# Altium schematic sheet rev-b1_pod_4_Sensors.SchDoc
size 297 x 209 mm; Symbol: Drawing-Symbol_A4; @Project Name: Atrium_RevB1; @Page Count: 4; @Update Date: 2026-11-05; @Create Date: 2026-11-05; @Schematic Name: Pod_Schematic; @Page No: 4; @Page Name: P2; Company: Local Forge; Version: V1.0; Page Size: A4; Drawn: Het Bhavsar; Device: Drawing-Symbol_A4; @Create Time: 20:16:03; @Update Time: 20:16:03; Border: 1; Width: 1170; Height: 825; Region Start: 1; X Region Count: 6; Y Region Count: 4; Blade Width: 10; Title Block Position: 3; @Board Name: Pod
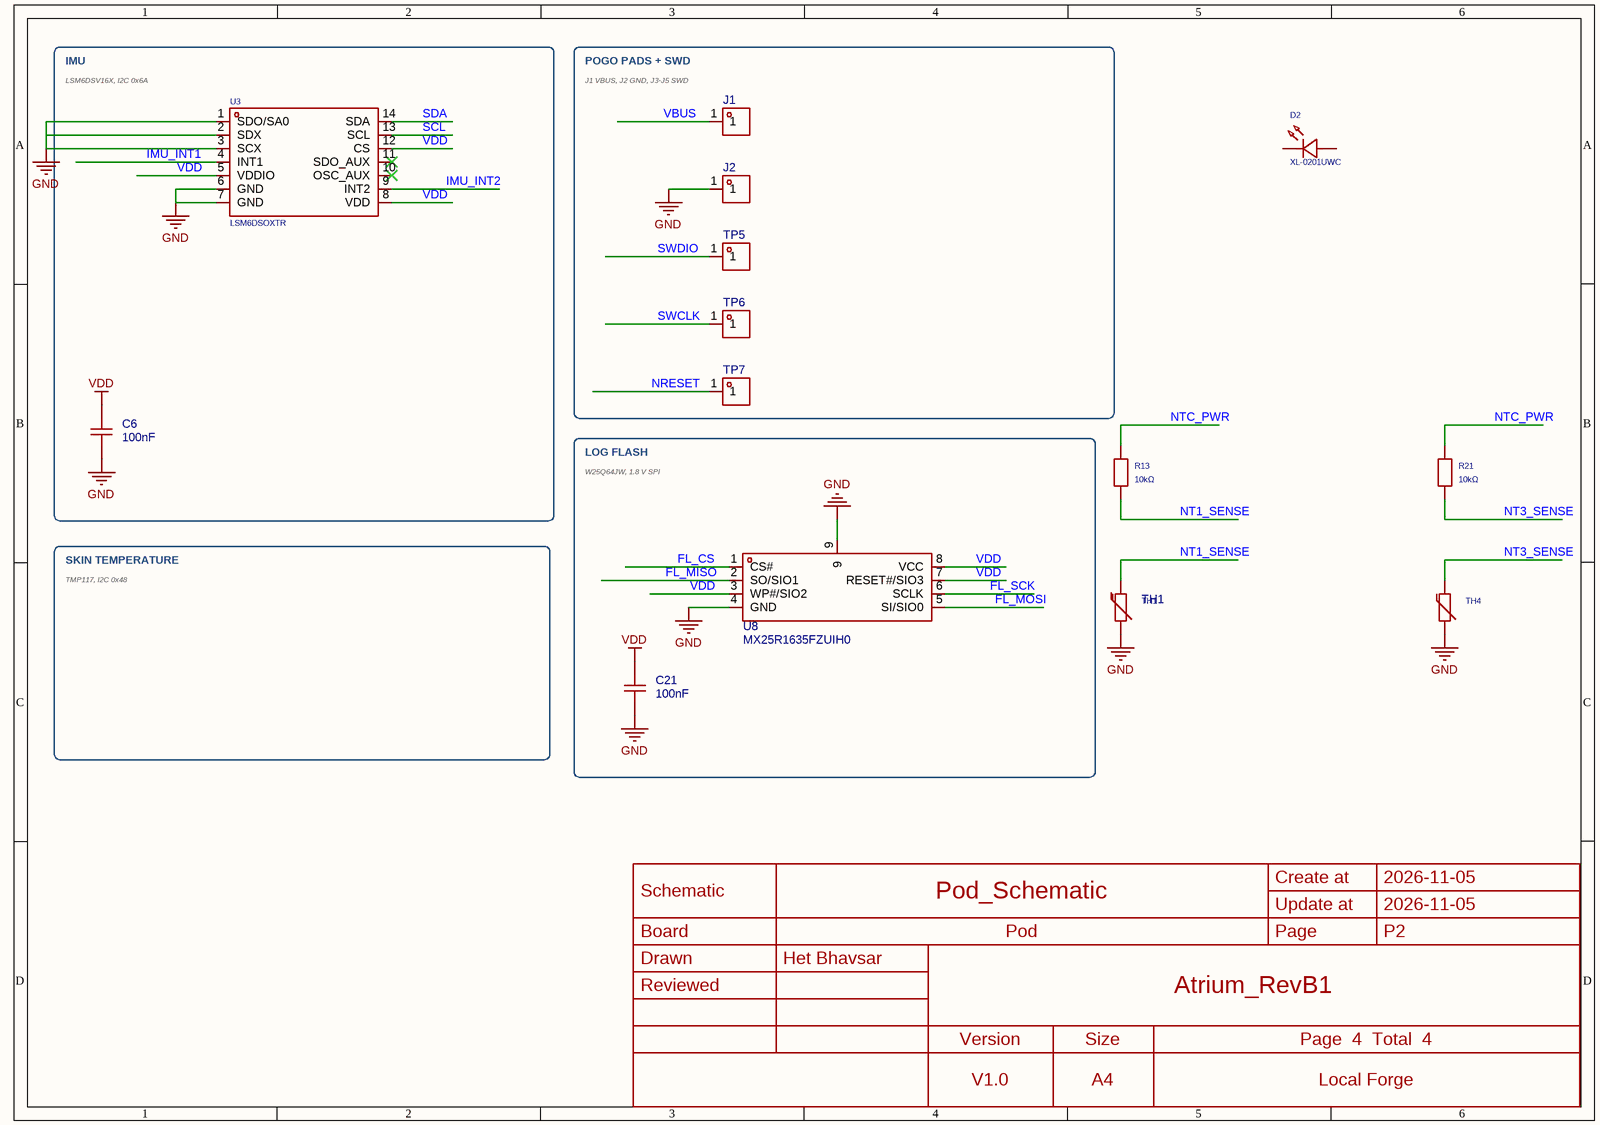
[diagram p0: rev-b1_pod_4_Sensors.SchDoc]

## Parts
(Parts that share a designator on the sheet are numbered #1, #2 ... from top to bottom, then left to right.)
C6  100nF  [C0201]
C21  100nF  [C0201]
D2  XL-0201UWC  [LED-SMD_L0.7-W0.4-RD_XL-0201UWC]
J1  YZR0154-15039-02  [TESTPOINT-SMD_BD1.5-H3.9]  (value not drawn)
J2  YZR0154-15039-02  [TESTPOINT-SMD_BD1.5-H3.9]  (value not drawn)
R13  10kΩ  [R0201]
R21  10kΩ  [R0201]
TH1#1  NCU15XH103F60RC  [R0402]  (value not drawn)
TH1#2  NCP03XH103F05RL  [R0201]  (value not drawn)
TH4  NCP03XH103F05RL  [R0201]  (value not drawn)
TP5  YZR0154-15039-02  [TESTPOINT-SMD_BD1.5-H3.9]  (value not drawn)
TP6  YZR0154-15039-02  [TESTPOINT-SMD_BD1.5-H3.9]  (value not drawn)
TP7  YZR0154-15039-02  [TESTPOINT-SMD_BD1.5-H3.9]  (value not drawn)
U3  LSM6DSOXTR  [LGA-14L_L3.0-W2.5-P0.50-TL]
U8  MX25R1635FZUIH0  [USON-8_L3.0-W2.0-P0.50-BL-EP1.6_MX25R1635FZUIH0]

## Blocks framed on the sheet
IMU: C6 U3
POGO PADS + SWD: J1 J2 TP5-TP7
LOG FLASH: C21 U8

## Nets
GND: C6.1 C21.1 J2.1 TH1#1.2 TH1#2.2 TH4.2 U3.1(SDO/SA0) U3.2(SDX) U3.3(SCX) U3.6(GND) U3.7(GND) U8.4(GND) U8.9
VDD: C6.2 C21.2 U3.5(VDDIO) U3.8(VDD) U3.12(CS) U8.3(WP#/SIO2) U8.7(RESET#/SIO3) U8.8(VCC)
FL_CS: U8.1(CS#)
FL_MISO: U8.2(SO/SIO1)
FL_MOSI: U8.5(SI/SIO0)
FL_SCK: U8.6(SCLK)
IMU_INT1: U3.4(INT1)
IMU_INT2: U3.9(INT2)
NRESET: TP7.1
NT1_SENSE: R13.2 TH1#1.1 TH1#2.1
NT3_SENSE: R21.2 TH4.1
NTC_PWR: R13.1 R21.1
SCL: U3.13(SCL)
SDA: U3.14(SDA)
SWCLK: TP6.1
SWDIO: TP5.1
VBUS: J1.1

Not connected (* = marked no-connect by the designer): D2 1(K) 2(A); U3 10(OSC_AUX)* 11(SDO_AUX)*

## Notes on the sheet
- LSM6DSV16X, I2C 0x6A
- J1 VBUS, J2 GND, J3-J5 SWD
- W25Q64JW, 1.8 V SPI
- SKIN TEMPERATURE
- TMP117, I2C 0x48
- Create at
- 2026-11-05
- Schematic
- Board
- Pod_Schematic
- Pod
- Update at
- Page
- P2
- Drawn
- Reviewed
- Het Bhavsar
- Atrium_RevB1
- Version
- V1.0
- Size
- A4
- Page  4  Total  4
- Local Forge

## Library data of the parts
C6 = CL03A104KO3NNNC: Capacitance:100nF Tolerance:±10% Tolerance:±10% Voltage Rating:16V Temperature Coefficient:X5R; Manufacturer: SAMSUNG(三星); Add into BOM: yes; 3D Model: c3e75c3d90204c70b153866ab54c789f0819f05c4eef4c71ace90d822a990e87; 3D Model Transform: 23.622,11.811,0,0,0,0,0,0,0; Tolerance: ±10%; Voltage Rating: 16V; Temperature Coefficient: X5R; ModelName: C0201_L0.6-W0.3-H0.3; Symbol: CL03A104KO3NNNC; Device: CL03A104KO3NNNC; Convert to PCB: yes; LCSC Part Name: 100nF ±10% 16V; Supplier Part: C307380; Manufacturer Part: CL03A104KO3NNNC; Supplier Footprint: 0201; JLCPCB Part Class: Extended Part; Datasheet: https://item.szlcsc.com/datasheet/CL03A104KO3NNNC/291054.html; Supplier: LCSC; Value: 100nF; FootprintName: C0201
C21 = CL03A104KO3NNNC: Capacitance:100nF Tolerance:±10% Tolerance:±10% Voltage Rating:16V Temperature Coefficient:X5R; Manufacturer: SAMSUNG(三星); Add into BOM: yes; Tolerance: ±10%; Voltage Rating: 16V; Temperature Coefficient: X5R; ModelId: c3e75c3d90204c70b153866ab54c789f0819f05c4eef4c71ace90d822a990e87; ModelName: C0201_L0.6-W0.3-H0.3; ModelTransform: 23.622,11.811,0,0,0,0,0,0,0; Symbol: CL03A104KO3NNNC; Device: CL03A104KO3NNNC; Convert to PCB: yes; Manufacturer Part: CL03A104KO3NNNC; Supplier: LCSC; Supplier Part: C307380; LCSC Part Name: 100nF ±10% 16V; Supplier Footprint: 0201; JLCPCB Part Class: Extended Part; Datasheet: https://item.szlcsc.com/datasheet/CL03A104KO3NNNC/291054.html; Value: 100nF; FootprintName: C0201
D2 = XL-0201UWC: Lamp Holder Type:0.65mm x 0.35mm square LED Illumination Color:White Voltage - Forward(Vf):2.8V Voltage - Forward(Vf):2.8V Power(Watts):70mW Test Current:20mA Wavelength - Dominant:- Wavelength - Dominant:- Peak Wavelength:- Peak Wavelength:- Diode Config; Manufacturer: XINGLIGHT(成兴光); Add into BOM: yes; Illumination Color: White; Voltage - Forward(Vf): 2.8V; Power(Watts): 70mW; Test Current: 20mA; Diode Configuration: Discrete Diode; Lens Color: Yellow Lens; Color Temperature: 5500K~6000K; Luminous Intensity: 185mcd; Viewing Angle: 120°; Symbol: XL-0201UWC; Device: XL-0201UWC; Convert to PCB: yes; Manufacturer Part: XL-0201UWC; Supplier: LCSC; Supplier Part: C965789; LCSC Part Name: 0201白贴片式发光二极管; Supplier Footprint: SMD,0.7x0.4mm; JLCPCB Part Class: Extended Part; Datasheet: https://item.szlcsc.com/datasheet/XL-0201UWC/1051398.html; Lamp Holder Type: 0.65mm x 0.35mm square LED; Wavelength - Dominant: -; Peak Wavelength: -; Mounting Style: Top-mount; Operating Temperature: -40℃~+85℃; FootprintName: LED-SMD_L0.7-W0.4-RD_XL-0201UWC
J1 J2 TP5-TP7 = YZR0154-15039-02: Type:Pogo Pin Number of Pins:1P Overall Length/Height:3.9mm Operational Height:3.1mm Contact Resistance:50mΩ Elastic Life:10000 times Current Rating:1A Voltage Rating:12V Contact Material:Lead-Free Copper Contact Plating:Gold Operating Temperature:-20℃~+7; Manufacturer: Xinyangze(鑫扬泽); Add into BOM: no; Overall Length/Height: 3.9mm; Operational Height: 3.1mm; Contact Resistance: 50mΩ; Current Rating: 1A; Voltage Rating: 12V; Symbol: YZR0154-15039-02; Device: YZR0154-15039-02; Convert to PCB: no; Manufacturer Part: YZR0154-15039-02; Supplier: LCSC; Supplier Part: C5157388; LCSC Part Name: POGO PIN贴片型弹簧顶针; Supplier Footprint: -; JLCPCB Part Class: Extended Part; Datasheet: https://item.szlcsc.com/datasheet/YZR0154-15039-02/5795506.html; Type: Pogo Pin; Number of Pins: 1P; Elastic Life: 10000 times; Contact Material: Lead-Free Copper; Contact Plating: Gold; Operating Temperature: -20℃~+70℃; FootprintName: TESTPOINT-SMD_BD1.5-H3.9
R13 R21 = RT0201BRD0710KL: Type:Thin Film Resistor Resistance:10kΩ Tolerance:±0.1% Tolerance:±0.1% Power(Watts):50mW Voltage-Supply(Max):25V Temperature Coefficient:±25ppm/℃ Temperature Coefficient:±25ppm/℃ Operating Temperature:-55℃~+125℃ Operating Temperature:-55℃~+125℃; Manufacturer: YAGEO(国巨); Add into BOM: yes; 3D Model: d3c6830bf3df48b598874c11a7d9c8170819f05c4eef4c71ace90d822a990e87; 3D Model Transform: 23.622,11.811,0,0,0,0,0,-0.0005,0; Tolerance: ±0.1%; Power(Watts): 50mW; Voltage-Supply(Max): 25V; ModelName: R0201_L0.6-W0.3-H0.3; Symbol: RT0201BRD0710KL; Device: RT0201BRD0710KL; Convert to PCB: yes; LCSC Part Name: 薄膜电阻 10kΩ ±0.1% 50mW; Supplier Part: C852211; Manufacturer Part: RT0201BRD0710KL; Supplier Footprint: 0201; JLCPCB Part Class: Extended Part; Datasheet: https://item.szlcsc.com/datasheet/RT0201BRD0710KL/912533.html; Supplier: LCSC; Type: Thin Film Resistor; Value: 10kΩ; Temperature Coefficient: ±25ppm/℃; Operating Temperature: -55℃~+125℃; FootprintName: R0201
TH1#1 = NCU15XH103F60RC: Power(Watts):1mW Resistance @ 25℃:10kΩ Resistance Tolerance:±1% Resistance Tolerance:±1% B Constant Tolerance:±1% B Constant (25℃/50℃):3380K B Constant (25℃/75℃):- B Constant (25℃/85℃):3434K B Constant (25℃/100℃):3455K Steady State Current (Max):- Dissipa; Manufacturer: muRata(村田); Add into BOM: yes; Power(Watts): 1mW; Resistance @ 25℃: 10kΩ; Resistance Tolerance: ±1%; B Constant (25℃/50℃): 3380K; B Constant (25℃/85℃): 3434K; B Constant (25℃/100℃): 3455K; Dissipation Factor: 1mW/℃; ModelId: efdecb7dae4442949d28eecaf748420f0819f05c4eef4c71ace90d822a990e87; ModelName: R0402_L1.0-W0.5-H0.4; ModelTransform: 39.37,19.685,0,0,0,0,0,0,0; Symbol: NCU15XH103F60RC; Device: NCU15XH103F60RC; Convert to PCB: yes; Manufacturer Part: NCU15XH103F60RC; Supplier: LCSC; Supplier Part: C237326; LCSC Part Name: 10kΩ 3380K; Supplier Footprint: 0402; JLCPCB Part Class: Extended Part; Datasheet: https://item.szlcsc.com/datasheet/NCU15XH103F60RC/236770.html; B Constant Tolerance: ±1%; B Constant (25℃/75℃): -; Steady State Current (Max): -; Thermal Time Constant: -; Operating Temperature: -40℃~+125℃; Diameter (φD): -; Length: 1mm; Width: 0.5mm; Height: -; Pitch: -; FootprintName: R0402
TH1#2 TH4 = NCP03XH103F05RL: Resistance @ 25℃:10kΩ B Constant (25℃/50℃):3380K Resistance Tolerance:±1% Resistance Tolerance:±1% B Constant (25℃/85℃):3434K B Constant (25℃/100℃):3455K Power(Watts):100mW B Constant Tolerance:±1% Operating Temperature:-40℃~+125℃ Operating Temperature:-4; Manufacturer: muRata(村田); Add into BOM: yes; 3D Model: d3c6830bf3df48b598874c11a7d9c8170819f05c4eef4c71ace90d822a990e87; 3D Model Transform: 23.622,11.811,0,0,0,0,0,-0.0005,0; Resistance @ 25℃: 10kΩ; B Constant (25℃/50℃): 3380K; Resistance Tolerance: ±1%; B Constant (25℃/85℃): 3434K; B Constant (25℃/100℃): 3455K; Power(Watts): 100mW; Dissipation Factor: 1mW/℃; Value: 10KΩ; ModelName: R0201_L0.6-W0.3-H0.3; Symbol: NCP03XH103F05RL; Device: NCP03XH103F05RL; Convert to PCB: yes; LCSC Part Name: 10kΩ 3380K 100mW; Supplier Footprint: 0201; Datasheet: https://item.szlcsc.com/datasheet/NCP03XH103F05RL/99307.html; B Constant Tolerance: ±1%; Operating Temperature: -40℃~+125℃; Manufacturer Part: NCP03XH103F05RL; Supplier: LCSC; Supplier Part: C98098; JLCPCB Part Class: Extended Part; FootprintName: R0201
U3 = LSM6DSOXTR: Accelerometer Sensing Axis:X,Y,Z Acceleration Measurement Range (MAX):±16g Acceleration Measurement Range (MAX):±16g Gyroscope Sensing Axis:X,Y,Z Gyroscope Measurement Range (MAX):±2000dps Gyroscope Measurement Range (MAX):±2000dps Sensor Type:IMU (accele; Manufacturer: ST(意法半导体); Add into BOM: yes; Accelerometer Sensing Axis: X,Y,Z; Acceleration Measurement Range (MAX): ±16g; Sensor Type: IMU (accelerometer + gyroscope); Interface: I2C；SPI; Voltage - Supply: 1.71V~3.6V; Cache Size: 9KB; Standby Current: 3uA; ModelId: ba71f3cdab504178a9a45bd067d2295b0819f05c4eef4c71ace90d822a990e87; ModelName: LGA-14_L2.5-W3.0-H0.9-P0.50; ModelTransform: 118.11,98.425,0,0,0,0,0,0.0005,0; Symbol: LSM6DSOXTR; Device: LSM6DSOXTR; Convert to PCB: yes; Manufacturer Part: LSM6DSOXTR; Supplier: LCSC; Supplier Part: C481766; LCSC Part Name: iNEMO惯性模块：常开式三维加速度计和三维陀螺仪; Supplier Footprint: LGA-14(2.5x3); JLCPCB Part Class: Extended Part; Datasheet: https://item.szlcsc.com/datasheet/LSM6DSOXTR/489350.html; Gyroscope Sensing Axis: X,Y,Z; Gyroscope Measurement Range (MAX): ±2000dps; Output Bits: -; Operating Temperature: -40℃~+85℃; Features: Motion event detection；Synchronization and timestamp; FootprintName: LGA-14L_L3.0-W2.5-P0.50-TL
U8 = MX25R1635FZUIH0: Interface:SPI Memory Size:16Mbit Clock Frequency:80MHz Voltage - Supply:1.65V~3.6V Voltage - Supply:1.65V~3.6V Standby Supply Current:0.1uA Program / Erase Cycles:100,000 cycles Write Cycle Time (tWC):- Page Programming Time (Tpp):850us Block Erase Time(t; Manufacturer: MXIC(旺宏电子); Add into BOM: yes; Interface: SPI; Memory Size: 16Mbit; Clock Frequency: 80MHz; Standby Supply Current: 0.1uA; Page Programming Time (Tpp): 850us; Data Retention - TDR (Year): 20 Years; ModelId: 1cc05f8f513a450c9380ce315c537d730819f05c4eef4c71ace90d822a990e87; ModelTransform: 79.1337,118.8974,0,0,0,0,0,0,0; Symbol: MX25R1635FZUIH0; Device: MX25R1635FZUIH0; Convert to PCB: yes; Manufacturer Part: MX25R1635FZUIH0; Supplier: LCSC; Supplier Part: C5687033; LCSC Part Name: 超低功耗16M位CMOS串行多I/O闪存; Supplier Footprint: USON-8(2x3); JLCPCB Part Class: Extended Part; Datasheet: https://item.szlcsc.com/datasheet/MX25R1635FZUIH0/6608770.html; Voltage - Supply: 1.65V~3.6V; Program / Erase Cycles: 100,000 cycles; Write Cycle Time (tWC): -; Block Erase Time(tBE): -; Operating Temperature: -40℃~+85℃; Features: Hardware write protection；Absolute write protection；Write enable latch；Software write protection；Power-on reset; FootprintName: USON-8_L3.0-W2.0-P0.50-BL-EP1.6_MX25R1635FZUIH0; ModelName: USON-8_L3.0-W2.0-P0.50-BL-EP1.6_MX25R1635FZUIH0